# Altium schematic sheet 3.Battery Management.SchDoc
size A4
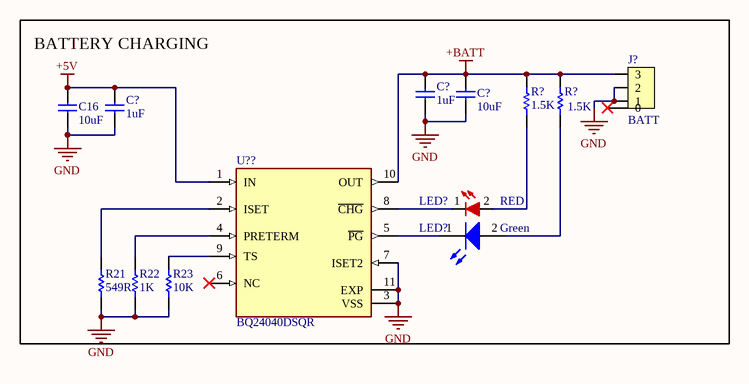
[diagram p0: 3.Battery Management.SchDoc]

## Parts
(Parts that share a designator on the sheet are numbered #1, #2 ... from top to bottom, then left to right.)
C16  10uF  [CAPC1608X06L]
C?#1  1uF  [CAPC1005X04L]
C?#2  10uF  [CAPC1608X06L]
C?#3  1uF  [CAPC1005X04L]
J?  BATT  [CONN_SMD_3P_1mm_SM03B-SRSS-TB]
LED?#1  RED  [LED-0603-RED]
LED?#2  Green  [LED-0603-Green]
R21  549R  [RESC1608X03L_C_2]
R22  1K  [RESC1608X03L_C_2]
R23  10K  [RESC1608X03L_C_2]
R?#1  1.5K  [RESC1608X03L_C_2]
R?#2  1.5K  [RESC1608X03L_C_2]
U??  BQ24040DSQR  [WSON-10-EP_2MMx2MM]

## Blocks framed on the sheet
BATTERY CHARGING: C16 C?#1-C?#3 J? LED?#1 LED?#2 R21-R23 R?#1 R?#2 U??

## Nets
+5V: C16.1 C?#3.1 U??.1(IN)
+BATT: C?#1.1 C?#2.1 J?.3 R?#1.2 R?#2.2 U??.10(OUT)
GND: C16.2 C?#1.2 C?#2.2 C?#3.2 J?.1 J?.2 R21.1 R22.1 R23.1 U??.3(VSS) U??.7(ISET2) U??.11(EXP)
NetLED?#1_1: LED?#1.1(K) U??.8(~{CHG})
NetLED?#1_2: LED?#1.2(A) R?#1.1
NetLED?#2_1: LED?#2.1(K) U??.5(~{PG})
NetLED?#2_2: LED?#2.2(A) R?#2.1
NetR21_2: R21.2 U??.2(ISET)
NetR22_2: R22.2 U??.4(PRETERM)
NetR23_2: R23.2 U??.9(TS)

Not connected (* = marked no-connect by the designer): J? 0*; U?? 6(NC)*

## Library data of the parts
C16 C?#2 = C0201-15p: Capacitor, NP0, ±5%, 25V; ComponentLink1URL: N.A.; ComponentLink1Description: Datasheet; ComponentLink2URL: N.A.; ComponentLink2Description: Supplier link; Package: 0603; LCSC: C386081
C?#1 C?#3 = C0402-1µ0: Capacitor, X5R, ±5%, 6.3V; LCSC: C52923; ComponentLink1URL: N.A.; ComponentLink1Description: Datasheet; ComponentLink2URL: N.A.; ComponentLink2Description: Supplier link; Package: 0402
J? = SM03B-SRSS-TB: 1.0mm pitch connector side entry SMD; ComponentLink1URL: N.A.; ComponentLink1Description: Datasheet; ComponentLink2URL: N.A.; ComponentLink2Description: Supplier link; LCSC: C160403
LED?#1 = LED0603_RED: LED RED CLEAR SMD; ComponentLink1URL: https://datasheet.ciiva.com/11773/0900766b80dc02b2-11773601.pdf?src-supplier=RSComponents; ComponentLink1Description: https://datasheet.ciiva.com/11773/0900766b80dc02b2-11773601.pdf?src-supplier=RSComponents; ComponentLink2URL: https://datasheet.ciiva.com/12400/lite-on-ltst-c191krkt-190135-12400910.pdf?src-supplier=Mouser; ComponentLink2Description: https://datasheet.ciiva.com/12400/lite-on-ltst-c191krkt-190135-12400910.pdf?src-supplier=Mouser; ComponentLink3URL: https://datasheet.ciiva.com/16212/ltst-c191krkt-16212419.pdf?src-supplier=Future+Electronics; ComponentLink3Description: https://datasheet.ciiva.com/16212/ltst-c191krkt-16212419.pdf?src-supplier=Future+Electronics; ComponentLink4URL: https://datasheet.ciiva.com/15117/getdatasheetpartid-141922-15117737.pdf?src-supplier=Verical; ComponentLink4Description: https://datasheet.ciiva.com/15117/getdatasheetpartid-141922-15117737.pdf?src-supplier=Verical; ComponentLink5URL: https://datasheet.ciiva.com/2109/s-110-ltst-c191krkt-2109971.pdf?src-supplier=Digi-Key; ComponentLink5Description: https://datasheet.ciiva.com/2109/s-110-ltst-c191krkt-2109971.pdf?src-supplier=Digi-Key; ComponentLink6URL: https://datasheet.ciiva.com/2109/s-110-ltst-c191krkt-2109970.pdf?src-supplier=Digi-Key; ComponentLink6Description: https://datasheet.ciiva.com/2109/s-110-ltst-c191krkt-2109970.pdf?src-supplier=Digi-Key; ComponentLink7URL: https://datasheet.ciiva.com/2109/s-110-ltst-c191krkt-2109972.pdf?src-supplier=Digi-Key; ComponentLink7Description: https://datasheet.ciiva.com/2109/s-110-ltst-c191krkt-2109972.pdf?src-supplier=Digi-Key; LCSC: C125099
LED?#2 = LED0: Typical INFRARED GaAs LED; LCSC: C434423
R21-R23 R?#1 R?#2 = Res1: Resistor
  R21: LCSC: C3016120
  R22: LCSC: C116692
  R23: LCSC: C103210
  R?#1 R?#2: LCSC: C22843
U?? = BQ24040DSQR: LCSC: C81080